# Altium schematic sheet Connector_Sheet_1.SchDoc
size A4; SheetNumber: 2; SheetTotal: 12
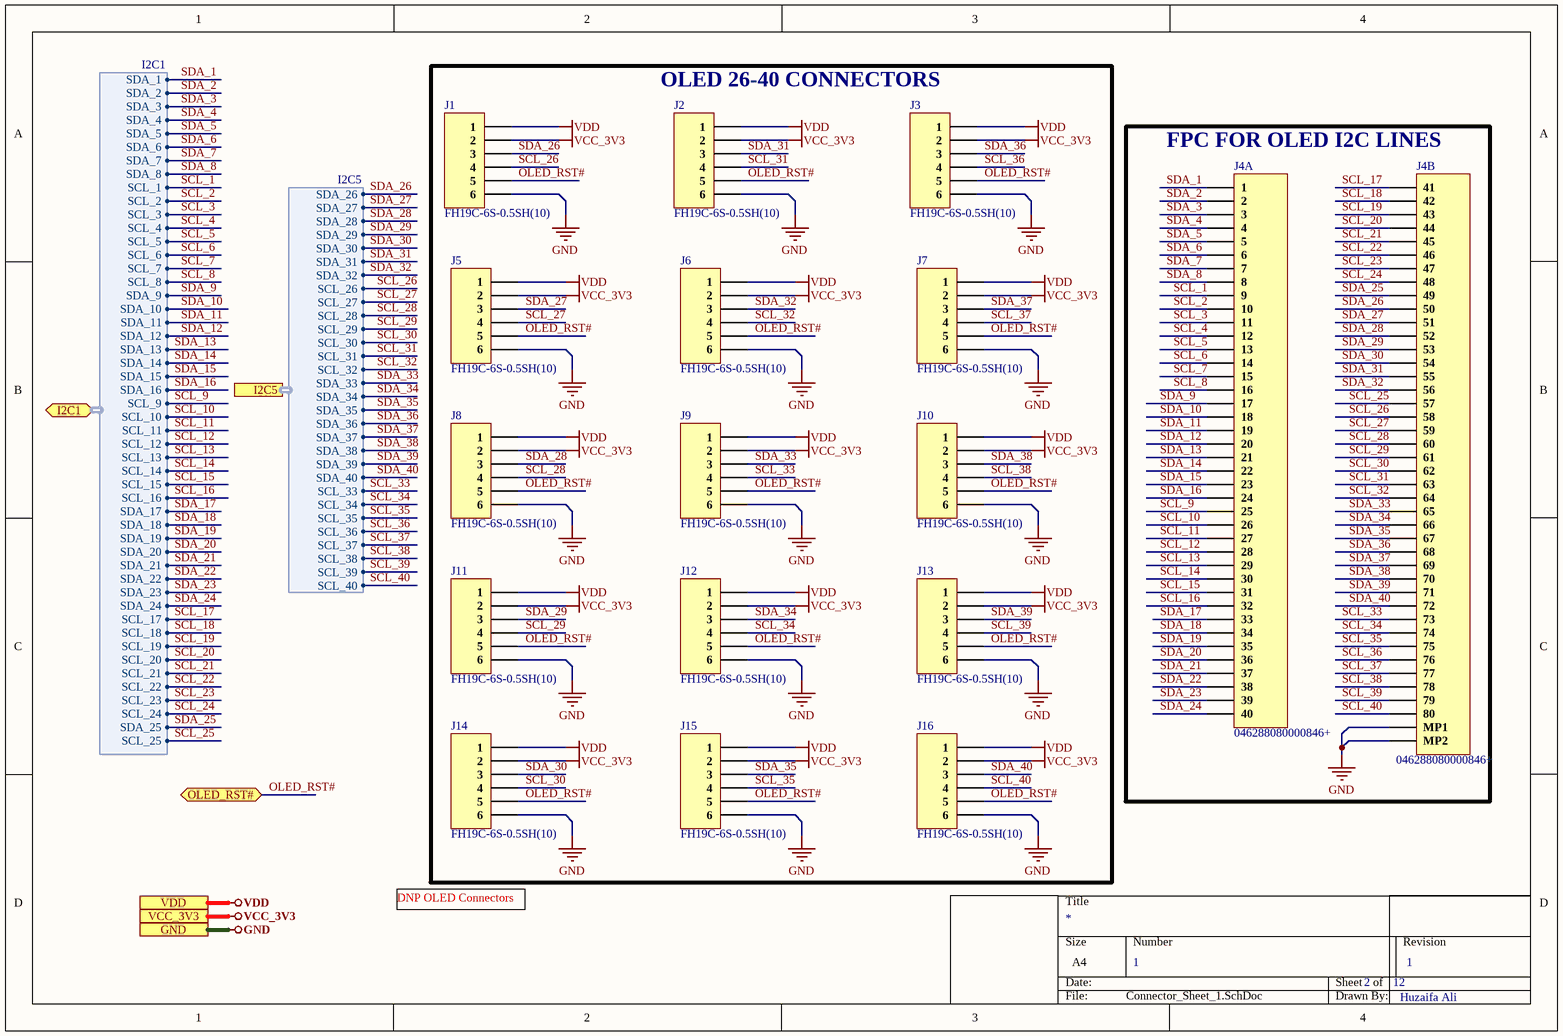
[diagram p0: Connector_Sheet_1.SchDoc]

## Parts
J1  FH19C-6S-0.5SH(10)  [FH19C-6S-0.5SH(10)]
J2  FH19C-6S-0.5SH(10)  [FH19C-6S-0.5SH(10)]
J3  FH19C-6S-0.5SH(10)  [FH19C-6S-0.5SH(10)]
J4  046288080000846+  [046288080000846+]  (parts A,B of 2)
J5  FH19C-6S-0.5SH(10)  [FH19C-6S-0.5SH(10)]
J6  FH19C-6S-0.5SH(10)  [FH19C-6S-0.5SH(10)]
J7  FH19C-6S-0.5SH(10)  [FH19C-6S-0.5SH(10)]
J8  FH19C-6S-0.5SH(10)  [FH19C-6S-0.5SH(10)]
J9  FH19C-6S-0.5SH(10)  [FH19C-6S-0.5SH(10)]
J10  FH19C-6S-0.5SH(10)  [FH19C-6S-0.5SH(10)]
J11  FH19C-6S-0.5SH(10)  [FH19C-6S-0.5SH(10)]
J12  FH19C-6S-0.5SH(10)  [FH19C-6S-0.5SH(10)]
J13  FH19C-6S-0.5SH(10)  [FH19C-6S-0.5SH(10)]
J14  FH19C-6S-0.5SH(10)  [FH19C-6S-0.5SH(10)]
J15  FH19C-6S-0.5SH(10)  [FH19C-6S-0.5SH(10)]
J16  FH19C-6S-0.5SH(10)  [FH19C-6S-0.5SH(10)]

## Blocks framed on the sheet
OLED 26-40 CONNECTORS: J1-J3 J5-J16
FPC FOR OLED I2C LINES: J4

## Ports
GND, I2C1 (bidir, harness I2C1), I2C5 (harness I2C5), OLED_RST# (bidir), VCC_3V3, VDD

## Harnesses
I2C1: SDA_1, SDA_2, SDA_3, SDA_4, SDA_5, SDA_6, SDA_7, SDA_8, SCL_1, SCL_2, SCL_3, SCL_4, SCL_5, SCL_6, SCL_7, SCL_8, SDA_9, SDA_10, SDA_11, SDA_12, SDA_13, SDA_14, SDA_15, SDA_16, SCL_9, SCL_10, SCL_11, SCL_12, SCL_13, SCL_14, SCL_15, SCL_16, SDA_17, SDA_18, SDA_19, SDA_20, SDA_21, SDA_22, SDA_23, SDA_24, SCL_17, SCL_18, SCL_19, SCL_20, SCL_21, SCL_22, SCL_23, SCL_24, SDA_25, SCL_25
I2C5: SDA_26, SDA_27, SDA_28, SDA_29, SDA_30, SDA_31, SDA_32, SCL_26, SCL_27, SCL_28, SCL_29, SCL_30, SCL_31, SCL_32, SDA_33, SDA_34, SDA_35, SDA_36, SDA_37, SDA_38, SDA_39, SDA_40, SCL_33, SCL_34, SCL_35, SCL_36, SCL_37, SCL_38, SCL_39, SCL_40

## Nets
GND: J1.6 J2.6 J3.6 J4.MP1 J4.MP2 J5.6 J6.6 J7.6 J8.6 J9.6 J10.6 J11.6 J12.6 J13.6 J14.6 J15.6 J16.6 ; port GND
VCC_3V3: J1.2 J2.2 J3.2 J5.2 J6.2 J7.2 J8.2 J9.2 J10.2 J11.2 J12.2 J13.2 J14.2 J15.2 J16.2 ; port VCC_3V3
VDD: J1.1 J2.1 J3.1 J5.1 J6.1 J7.1 J8.1 J9.1 J10.1 J11.1 J12.1 J13.1 J14.1 J15.1 J16.1 ; port VDD
OLED_RST#: J1.5 J2.5 J3.5 J5.5 J6.5 J7.5 J8.5 J9.5 J10.5 J11.5 J12.5 J13.5 J14.5 J15.5 J16.5 ; port OLED_RST#
SCL_1: J4.9 ; port I2C1.SCL_1
SCL_2: J4.10 ; port I2C1.SCL_2
SCL_3: J4.11 ; port I2C1.SCL_3
SCL_4: J4.12 ; port I2C1.SCL_4
SCL_5: J4.13 ; port I2C1.SCL_5
SCL_6: J4.14 ; port I2C1.SCL_6
SCL_7: J4.15 ; port I2C1.SCL_7
SCL_8: J4.16 ; port I2C1.SCL_8
SCL_9: J4.25 ; port I2C1.SCL_9
SCL_10: J4.26 ; port I2C1.SCL_10
SCL_11: J4.27 ; port I2C1.SCL_11
SCL_12: J4.28 ; port I2C1.SCL_12
SCL_13: J4.29 ; port I2C1.SCL_13
SCL_14: J4.30 ; port I2C1.SCL_14
SCL_15: J4.31 ; port I2C1.SCL_15
SCL_16: J4.32 ; port I2C1.SCL_16
SCL_17: J4.41 ; port I2C1.SCL_17
SCL_18: J4.42 ; port I2C1.SCL_18
SCL_19: J4.43 ; port I2C1.SCL_19
SCL_20: J4.44 ; port I2C1.SCL_20
SCL_21: J4.45 ; port I2C1.SCL_21
SCL_22: J4.46 ; port I2C1.SCL_22
SCL_23: J4.47 ; port I2C1.SCL_23
SCL_24: J4.48 ; port I2C1.SCL_24
SCL_25: J4.57 ; port I2C1.SCL_25
SCL_26: J1.4 J4.58 ; port I2C5.SCL_26
SCL_27: J4.59 J5.4 ; port I2C5.SCL_27
SCL_28: J4.60 J8.4 ; port I2C5.SCL_28
SCL_29: J4.61 J11.4 ; port I2C5.SCL_29
SCL_30: J4.62 J14.4 ; port I2C5.SCL_30
SCL_31: J2.4 J4.63 ; port I2C5.SCL_31
SCL_32: J4.64 J6.4 ; port I2C5.SCL_32
SCL_33: J4.73 J9.4 ; port I2C5.SCL_33
SCL_34: J4.74 J12.4 ; port I2C5.SCL_34
SCL_35: J4.75 J15.4 ; port I2C5.SCL_35
SCL_36: J3.4 J4.76 ; port I2C5.SCL_36
SCL_37: J4.77 J7.4 ; port I2C5.SCL_37
SCL_38: J4.78 J10.4 ; port I2C5.SCL_38
SCL_39: J4.79 J13.4 ; port I2C5.SCL_39
SCL_40: J4.80 J16.4 ; port I2C5.SCL_40
SDA_1: J4.1 ; port I2C1.SDA_1
SDA_2: J4.2 ; port I2C1.SDA_2
SDA_3: J4.3 ; port I2C1.SDA_3
SDA_4: J4.4 ; port I2C1.SDA_4
SDA_5: J4.5 ; port I2C1.SDA_5
SDA_6: J4.6 ; port I2C1.SDA_6
SDA_7: J4.7 ; port I2C1.SDA_7
SDA_8: J4.8 ; port I2C1.SDA_8
SDA_9: J4.17 ; port I2C1.SDA_9
SDA_10: J4.18 ; port I2C1.SDA_10
SDA_11: J4.19 ; port I2C1.SDA_11
SDA_12: J4.20 ; port I2C1.SDA_12
SDA_13: J4.21 ; port I2C1.SDA_13
SDA_14: J4.22 ; port I2C1.SDA_14
SDA_15: J4.23 ; port I2C1.SDA_15
SDA_16: J4.24 ; port I2C1.SDA_16
SDA_17: J4.33 ; port I2C1.SDA_17
SDA_18: J4.34 ; port I2C1.SDA_18
SDA_19: J4.35 ; port I2C1.SDA_19
SDA_20: J4.36 ; port I2C1.SDA_20
SDA_21: J4.37 ; port I2C1.SDA_21
SDA_22: J4.38 ; port I2C1.SDA_22
SDA_23: J4.39 ; port I2C1.SDA_23
SDA_24: J4.40 ; port I2C1.SDA_24
SDA_25: J4.49 ; port I2C1.SDA_25
SDA_26: J1.3 J4.50 ; port I2C5.SDA_26
SDA_27: J4.51 J5.3 ; port I2C5.SDA_27
SDA_28: J4.52 J8.3 ; port I2C5.SDA_28
SDA_29: J4.53 J11.3 ; port I2C5.SDA_29
SDA_30: J4.54 J14.3 ; port I2C5.SDA_30
SDA_31: J2.3 J4.55 ; port I2C5.SDA_31
SDA_32: J4.56 J6.3 ; port I2C5.SDA_32
SDA_33: J4.65 J9.3 ; port I2C5.SDA_33
SDA_34: J4.66 J12.3 ; port I2C5.SDA_34
SDA_35: J4.67 J15.3 ; port I2C5.SDA_35
SDA_36: J3.3 J4.68 ; port I2C5.SDA_36
SDA_37: J4.69 J7.3 ; port I2C5.SDA_37
SDA_38: J4.70 J10.3 ; port I2C5.SDA_38
SDA_39: J4.71 J13.3 ; port I2C5.SDA_39
SDA_40: J4.72 J16.3 ; port I2C5.SDA_40

## Notes on the sheet
- DNP OLED Connectors
- 1
- Huzaifa Ali

## Library data of the parts
J1-J3 J5-J16 = FH19C-6S-0.5SH(10): 0.5mm Pitch, 0.9mm Height, No of Contact 4-50, FPC/FFC Connector, 0.5 A, -55 to 85 ℃, RoHS; Manufacturer: Hirose; Supplier 1: Digi-Key; Manufacturer Part Number: FH19C-6S-0.5SH(10); RoHS: Yes; Category: FFC / FPC; Stock 1: 1159; Pricing 1: 1=1.10000, 10=0.96900, 25=0.91200, 50=0.87400, 100=0.83600, 250=0.76000, 500=0.68400, 1000=0.60800, 2500=0.55100 (USD); ComponentLink1URL: https://datasheet.ciiva.com/18563/ed-fh19cfh19sc-20140305-18563530.pdf?src-supplier=Digi-Key; ComponentLink1Description: https://datasheet.ciiva.com/18563/ed-fh19cfh19sc-20140305-18563530.pdf?src-supplier=Digi-Key; Supplier Part Number 1: H125824CT-ND
J4 = 046288080000846+: 0.5MM PITCH - 80 POS - RIGHT ANG; Manufacturer: Kyocera AVX; Manufacturer Part No: 046288080000846+; Package: Custom; ComponentLink1Description: LCSC; ComponentLink1URL: https://lcsc.com/product-detail/FFC-span-style-background-color-ff0-FPC-span-Connectors_Kyocera-046288080000846_C513346.html